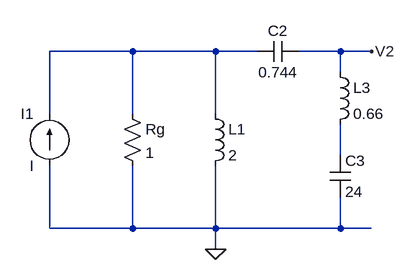
[diagram p0: schematic Ejercicio3.asc]
Ejercicio3.asc, the LTspice schematic file:
Version 4.1
SHEET 1 880 680
WIRE 192 48 64 48
WIRE 320 48 192 48
WIRE 384 48 320 48
WIRE 512 48 448 48
WIRE 560 48 512 48
WIRE 512 80 512 48
WIRE 64 144 64 48
WIRE 192 144 192 48
WIRE 320 144 320 48
WIRE 512 208 512 160
WIRE 64 320 64 224
WIRE 192 320 192 224
WIRE 192 320 64 320
WIRE 320 320 320 224
WIRE 320 320 192 320
WIRE 512 320 512 272
WIRE 512 320 320 320
WIRE 560 320 512 320
WIRE 320 352 320 320
FLAG 320 352 0
FLAG 560 48 V2
SYMBOL current 64 224 R180
WINDOW 0 24 80 Left 2
WINDOW 3 24 0 Left 2
SYMATTR InstName I1
SYMBOL res 176 128 R0
SYMATTR InstName Rg
SYMATTR Value 1
SYMBOL ind 304 128 R0
SYMATTR InstName L1
SYMATTR Value 2
SYMATTR SpiceLine Rser=1m
SYMBOL cap 448 32 R90
WINDOW 0 0 32 VBottom 2
WINDOW 3 32 32 VTop 2
SYMATTR InstName C2
SYMATTR Value 0.744
SYMBOL ind 496 64 R0
SYMATTR InstName L3
SYMATTR Value 0.66
SYMATTR SpiceLine Rser=1m
SYMBOL cap 496 208 R0
SYMATTR InstName C3
SYMATTR Value 24

The netlist it stands for:
* Ejercicio3.asc
I1 0 N001 I
Rg N001 0 1
L1 N001 0 2 Rser=1m
C2 V2 N001 0.744
L3 V2 N002 0.66 Rser=1m
C3 N002 0 24
.backanno
.end